# EAGLE design Adafruit Si5351C 8 Channel TCXO Clock Generator rev B (EAGLE 9.6.2)
COMPANY: ADAFRUIT INDUSTRIES; DRAWN: KTOWN; REV: A
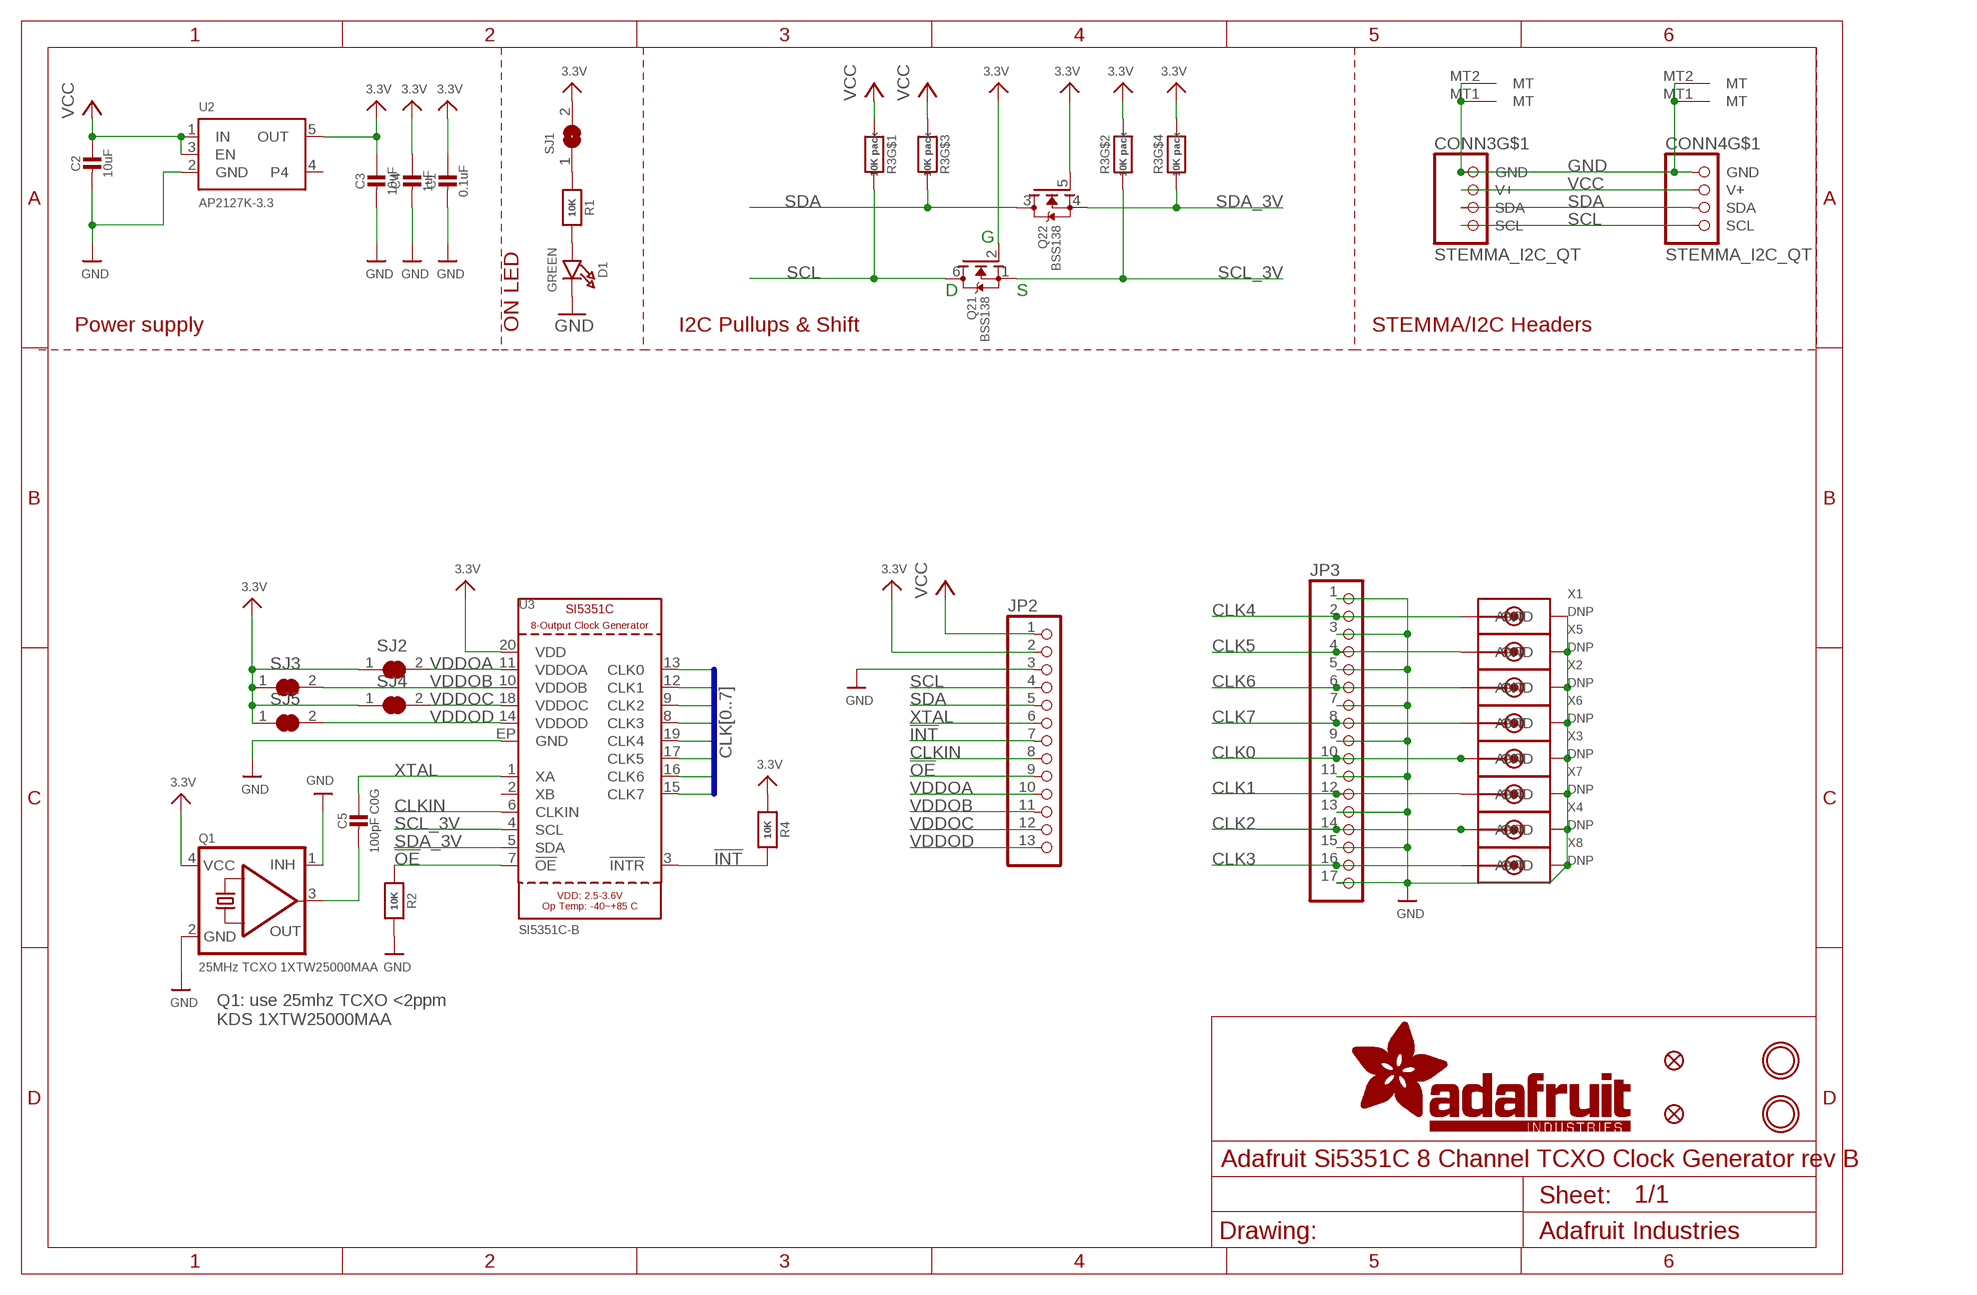
[diagram p0: schematic, sheet 1]

## Parts
C1  0.1uF  CAP_CERAMIC0603_NO  [0603-NO]
C2  10uF  CAP_CERAMIC0805-NOOUTLINE  [0805-NO]
C3  10uF  CAP_CERAMIC0805-NOOUTLINE  [0805-NO]
C4  1uF  CAP_CERAMIC0603_NO  [0603-NO]
C5  100pF C0G  CAP_CERAMIC0603_NO  [0603-NO]
CONN3  STEMMA_I2C_QT  [JST_SH4]
CONN4  STEMMA_I2C_QT  [JST_SH4]
D1  GREEN  LED0603_NOOUTLINE  [CHIPLED_0603_NOOUTLINE]
FID3  FIDUCIAL_0.5MM  [FIDUCIAL_0.5MM]
FID4  FIDUCIAL_0.5MM  [FIDUCIAL_0.5MM]
JP2  HEADER-1X13  [1X13_ROUND_70]
JP3  HEADER-1X17  [1X17_ROUND70]
Q1  25MHz TCXO 1XTW25000MAA  OSCILLATOR3.2X2.5  [OSC_3.2X2.5MM]
Q2  BSS138  MOSFET-N_DUAL  [SOT363]
R1  10K  RESISTOR_0603_NOOUT  [0603-NO]
R2  10K  RESISTOR_0603_NOOUT  [0603-NO]
R3  10K pack  RESISTOR_4PACK  [RESPACK_4X0603]
R4  10K  RESISTOR_0603_NOOUT  [0603-NO]
SJ1  SOLDERJUMPERCLOSED  [SOLDERJUMPER_CLOSEDWIRE]
SJ2  SOLDERJUMPER_CLOSED  [SOLDERJUMPER_CLOSEDWIRE]
SJ3  SOLDERJUMPER_CLOSED  [SOLDERJUMPER_CLOSEDWIRE]
SJ4  SOLDERJUMPER_CLOSED  [SOLDERJUMPER_CLOSEDWIRE]
SJ5  SOLDERJUMPER_CLOSED  [SOLDERJUMPER_CLOSEDWIRE]
U2  AP2127K-3.3  VREG_SOT23-5  [SOT23-5]
U3  SI5351C-B  SI5351C  [QFN20_4X4_0.5_SKY]
U$19  MOUNTINGHOLE2.5  [MOUNTINGHOLE_2.5_PLATED]
U$21  MOUNTINGHOLE2.5  [MOUNTINGHOLE_2.5_PLATED]
X1  DNP  SMA_EDGE  [SMA_EDGELAUNCH]
X2  DNP  SMA_EDGE  [SMA_EDGELAUNCH]
X3  DNP  SMA_EDGE  [SMA_EDGELAUNCH]
X4  DNP  SMA_EDGE  [SMA_EDGELAUNCH]
X5  DNP  SMA_EDGE  [SMA_EDGELAUNCH]
X6  DNP  SMA_EDGE  [SMA_EDGELAUNCH]
X7  DNP  SMA_EDGE  [SMA_EDGELAUNCH]
X8  DNP  SMA_EDGE  [SMA_EDGELAUNCH]

## Nets
3.3V [lowpower]: C1.1 C3.1 C4.1 JP2.2 Q1.4(VCC) Q2.2(1:G) Q2.5(2:G) R3.2 R3.4 R4.1 SJ1.2 SJ2.1 SJ3.1 SJ4.1 SJ5.1 U2.5(OUT) U3.20(VDD)
!INT: JP2.7 R4.2 U3.3(!INTR)
!OE: JP2.9 R2.1 U3.7(!OE)
CLK0: JP3.10 U3.13(CLK0) X3.P(ANT)
CLK1: JP3.12 U3.12(CLK1) X7.P(ANT)
CLK2: JP3.14 U3.9(CLK2) X4.P(ANT)
CLK3: JP3.16 U3.8(CLK3) X8.P(ANT)
CLK4: JP3.2 U3.19(CLK4) X1.P(ANT)
CLK5: JP3.4 U3.17(CLK5) X5.P(ANT)
CLK6: JP3.6 U3.16(CLK6) X2.P(ANT)
CLK7: JP3.8 U3.15(CLK7) X6.P(ANT)
CLKIN: JP2.8 U3.6(CLKIN)
GND [highpower]: C1.2 C2.2 C3.2 C4.2 CONN3.1(GND) CONN3.MT1(MT) CONN3.MT2(MT) CONN4.1(GND) CONN4.MT1(MT) CONN4.MT2(MT) D1.C JP2.3 JP3.1 JP3.3 JP3.5 JP3.7 JP3.9 JP3.11 JP3.13 JP3.15 JP3.17 Q1.1(INH) Q1.2(GND) R2.2 U2.2(GND) U3.EP(GND) X1.GND@1(GND) X1.GND@2(GND) X1.GND@3(GND) X1.GND@4(GND) X2.GND@1(GND) X2.GND@2(GND) X2.GND@3(GND) X2.GND@4(GND) X3.GND@1(GND) X3.GND@2(GND) X3.GND@3(GND) X3.GND@4(GND) X4.GND@1(GND) X4.GND@2(GND) X4.GND@3(GND) X4.GND@4(GND) X5.GND@1(GND) X5.GND@2(GND) X5.GND@3(GND) X5.GND@4(GND) X6.GND@1(GND) X6.GND@2(GND) X6.GND@3(GND) X6.GND@4(GND) X7.GND@1(GND) X7.GND@2(GND) X7.GND@3(GND) X7.GND@4(GND) X8.GND@1(GND) X8.GND@2(GND) X8.GND@3(GND) X8.GND@4(GND)
N$1: D1.A R1.2
N$2 [lowpower]: R1.1 SJ1.1
N$4: C5.2 Q1.3(OUT)
SCL: CONN3.4(SCL) CONN4.4(SCL) JP2.4 Q2.6(1:D) R3.8
SCL_3V: Q2.1(1:S) R3.7 U3.4(SCL)
SDA: CONN3.3(SDA) CONN4.3(SDA) JP2.5 Q2.3(2:D) R3.6
SDA_3V: Q2.4(2:S) R3.5 U3.5(SDA)
VCC [highpower]: C2.1 CONN3.2(V+) CONN4.2(V+) JP2.1 R3.1 R3.3 U2.1(IN) U2.3(EN)
VDDOA: JP2.10 SJ2.2 U3.11(VDDOA)
VDDOB: JP2.11 SJ3.2 U3.10(VDDOB)
VDDOC: JP2.12 SJ4.2 U3.18(VDDOC)
VDDOD: JP2.13 SJ5.2 U3.14(VDDOD)
XTAL: C5.1 JP2.6 U3.1(XA)
Unconnected: U2.4 U3.2(XB)

## Buses
CLK[0..7]

## Notes on the sheet
- G
- D | S
- Power supply | ON LED | I2C Pullups & Shift | STEMMA/I2C Headers
- Q1: use 25mhz TCXO <2ppm
  KDS 1XTW25000MAA

## Library data of the parts
C1-C5 = microbuilder:CAP_CERAMIC: Ceramic Capacitors For new designs, use the packages preceded by an '_' character since they are more reliable: The following footprints should be used on most boards: _0402 - Standard footprint for regular board layouts _0603 - Standard footprint for regular board layouts _0805 - Standard footprint for regular board layouts _1206 - Standard footprint for regular board layouts For extremely tight-pitch boards where space is at a premium, the following 'micro-pitch' footprints can be used (smaller pads, no silkscreen outline, etc.): _0402MP - Micro-pitch footprint for very dense/compact boards _0603MP - Micro-pitch footprint for very dense/compact boards _0805MP - Micro-pitch footprint for very dense/compact boards _1206MP - Micro-pitch footprint for very dense/compact boards
CONN3 CONN4 = adafruit_electromech:STEMMA_I2C; LCSC: C2905006
D1 = microbuilder:LED: LED 0603 - 0603 Surface Mount Package 2mA: Green LED - Low Power (3.9mcd, 2ma, 1.7Vf) - Digikey: 475-2709-2-ND Orange LED - Low Power (9.8mcd, 2ma, 1.8Vf) - Digikey: 475-1194-2-ND Red LED - Low Power (5mcd, 2ma, 1.8Vf) - Digikey: 475-1195-2-ND Yellow LED - Low Power (7mcd, 2ma, 1.8Vf) - Digikey: 475-1196-2-ND 5mA: Blue LED - Low Power (17mcd, 5ma, 2.9Vf) - Digikey: LNJ937W8CRACT-ND 0805 - 0805 Surface Mount Package 2mA: Red LED (8.8mcd, 2mA, 1.8Vf, Clear) - Low Power [Digikey: 475-2510-1-ND] Green LED (5mcd, 2mA, 1.8Vf, Clear) - Low Power [Digikey: 475-2730-1-ND] Yellow LED (11.3mcd, 2mA, 1.8Vf, Clear) - Low Power [Digikey: 475-2555-1-ND] 20mA: Red LED (104mcd, 20mA, Diffused) - LS R976 [Digikey: 475-1278-6-ND] Red LED (12mcd, 20mA, 2.0Vf, Clear) - APT2012EC [Digikey: 754-1128-1-ND] Green LED (15mcd, 20mA, 2.2Vf, Clear) - APT2012GC [Digikey: 754-1131-1-ND] Orange LED (160mcd, 20mA, 2.1Vf, Clear) - APT2012SECK [Digikey: 754-1130-1-ND] 1206 - 1206 Surface Mount Package Green LED (26mcd, 20mA, Diffused) - LG N971 [Digikey: 475-1407-6-ND] Red LED (15mcd, 20mA, Diffused) - LH N974 [Digikey: 475-1416-6-ND] Cree - Cree High-Power Surface Mount LEDs XPEBWT-L1-0000-00D50 - White 111lm 350mA 2.9Vf 6200K 110° XTEAWT-00-0000-00000LEE3 - White 114lm 350mA 2.85Vf 5000K 115° Everlight - Everlight 45-21 Series Surface Mount LEDs 45-21/QK2C-B2832AC2CB2/2T - Warm White 2000mcd 20mA 3.25Vf 3050K 120° 45-21/LK2C-B38452C4CB2/2T - Nuetral White 2000mcd 20mA 3.25Vf 4150K 120° 45-21/LK2C-B50634C6CB2/2T - Cold White 2200mcd 20mA 3.25Vf 5650K 120° PLCC2 Reverse Mount LS T77K-J1L2-1-0-2-R18-Z - Red 11.25mcd 2mA 1.8Vf 630nm 120° LO T77K-L1M2-24-Z - Orange 19.6mcd 2mA 1.8Vf 606nm 120° LY T77K-K2M1-26-Z - Yellow 15.7mcd 2mA 1.8Vf 587nm 120°; ROT: 270
FID3 FID4 = microbuilder:FIDUCIAL: Fiducial Alignment Points Various fiducial points for machine vision alignment.
JP2 = adafruit_electromech:HEADER-1X13
JP3 = microbuilder:HEADER-1X17: Header 1x17
Q1 = microbuilder:OSCILLATOR: Oscillators 3.2x2.5mm SMT 4.0MHz +/- 50ppm, 3.3V, 9mA, -40/+85°C - Digikey: 535-9752-1-ND 50MHz +/- 50ppm, 3.3V, 8mA, -10/+70°C - Digikey: 478-4792-1-ND 5x7mm SMT 4.0MHz +/-20ppm 3.3V, 20mA, -20/+70°C - Digikey: 535-9329-2-ND 50MHz +/- 25ppm 3.3V, 35mA, -40/+85°C - Digikey: 631-1197-1-ND
Q2 = microbuilder:MOSFET-N_DUAL: Dual N-Channel MOSFET SOT363 (2.0x1.25mm) 2N7002PS - 60V, 320mA [Digikey: 568-5984-1-ND]; JLC_ROTATION: 270
R1 R2 R4 = microbuilder:RESISTOR: Resistors For new designs, use the packages preceded by an '_' character since they are more reliable: The following footprints should be used on most boards: _0402 - Standard footprint for regular board layouts _0603 - Standard footprint for regular board layouts _0805 - Standard footprint for regular board layouts _1206 - Standard footprint for regular board layouts For extremely tight-pitch boards where space is at a premium, the following 'micro-pitch' footprints can be used (smaller pads, no silkscreen outline, etc.): _0402MP - Micro-pitch footprint for very dense/compact boards _0603MP - Micro-pitch footprint for very dense/compact boards _0805MP - Micro-pitch footprint for very dense/compact boards _1206MP - Micro-pitch footprint for very dense/compact boards
R3 = microbuilder:RESISTOR_4PACK: Resistor Packs (4 resistors) 4 x 0603 10K 1/16W - Digikey: YC164J-10KCT-ND
SJ1 = microbuilder:SOLDERJUMPER: SMD Solder JUMPER Solder the two pads together to create a connection, or remove the solder to break it. REFLOW - Use this footprint for solder paste and reflow ovens. WAVE - Use this footprint for hand-soldering (larger pads). CLOSED - Has a trace between the two pads to ensure it is closed by default. The trace needs to be cut to disable the jumper, and can be closed again by creating a solder bridge between the two pads.
SJ2-SJ5 = microbuilder:SOLDERJUMPER_CLOSED: Solder Jumper - Closed These solder jumpers are closed by default CLOSEDWIRE - 10 mil trace between pads that can be cut and resoldered later CLOSEDPERM - 63 mil trace between pads for a permanent connection (used to 'bridge' two signals, a shameless hack for Eagle). Can double as a test point as well (no cream layer)
U2 = adafruit_power:VREG_SOT23-5: SOT23-5 Fixed Voltage Regulators Part Current Out V Out V In V Dropout θJA (°C/W) TJ (°C) Digikey Part No. ADP121 150mA 3.3V 3.4-5.5V 0.09V @ 150mA -- -- ADP121-AUJZ33R7CT-ND ADP121 150mA 3.0V 3.1-5.5V 0.09V @ 150mA -- -- ADP121-AUJZ30R7CT-ND ADP122 300mA 3.3V 3.4-5.5V 0.085V @ 300mA -- -- ADP122AUJZ-3.3-R7CT-ND ADP1712 300mA 3.3V 3.5-5.5V 0.17V @ 300mA -- -- ADP1712AUJZ-3.3-R7TR-ND AP7311 (Low Cost) 150mA 3.3V 3.5-6V 0.15V @ 150mA -- -- AP7311-33WG-7DICT-ND LD39015M18R 150mA 1.8V 1.9V-5.5V 0.08V @ 100mA -- -- 497-6977-1-ND LP2985A-33DBVR 150mA 3.3V 3.3-16V 0.28V @ 150mA 206 150 296-18479-1-ND MCP1824T-3302E/OT 300mA 3.3V 3.5V-6V 0.2V @ 300mA -- -- MCP1824T-3302E/OTCT-ND MIC5205-2.5YM5 TR 150mA 2.5V 2.7-16V 0.165V @ 150mA -- -- 576-1257-2-ND MIC5205-3.0YM5 TR 150mA 3.0V 3.2V-16V 0.165V @ 150mA -- -- 576-1258-2-ND MIC5205-3.3YM5 TR 150mA 3.3V 3.5V-16V 0.165V @ 150mA -- -- 576-1259-2-ND TPS780330220 150mA 3.3V+2.2V 3.6-5.5V 250mV Max -- -- 296-23332-1-ND TDA3663/N1,135 100mA 3.3V 3.5-45V 0.18V @ 50mA -- -- 568-5343-1-ND Max operating temp can be calculated using θJA, TJ (max junction temperature), and power in watts. Set the "Maximum Ambient Temperature" until it reaches TJ ("Max Junction Temperature"), which is the absolute limit for safe use of the regulator: Heat Sink Temperature Calculator <http://www.daycounter.com/Calculators/Heat-Sink-Temperature-Calculator.phtml> For example, With 12V source into a 3.3V LP2985 and a 30mA load, we are dissipating (12V-3.3V) * 0.03A = 0.261W. With a θJA of 206 °C/W, a TJ of 150°C, and 261mW we can safely use the chip without a heat sink up to 75°C (=147.1°C Junction Temperature).; JLC_ROTATION: 270
U3 = microbuilder:SI5351C: SI5351C - 8-Output I2C Clock Generator with External Clock Input Skyworks (formerly Silicon Labs) Si5351C. Any-frequency clock generator with two PLLs and 8 independent output drivers (CLK0-CLK7). Drives separate output banks (CLK0/1, CLK2/3, CLK4/5, CLK6/7) with independent VDDO supplies (1.8/2.5/3.3V). I2C control. Includes external clock input (CLKIN) and open-drain interrupt output (INTR). VDD: 2.5-3.6V. Op temp: -40~+85 C. 20-pin QFN 4x4mm 0.5mm pitch.
U$19 U$21 = adafruit_electromech:MOUNTINGHOLE: Mounting Hole For #2 screws (0.086"/2.18mm width, 0.094"/2.4mm hole) use 2.5mm; BOM: EXCLUDE
X1-X8 = microbuilder:SMA_EDGE: SMA Edge-Launch Connector - simplified single-GND symbol 50 Ohm SMA edge-launch (or U.FL footprint variant). Functionally identical to SMACONNECTOR_EDGE/_EDGE_UFL but with a single GND symbol pin instead of GND1-4 — easier to wire in new schematics.

## Net classes
1 highpower: width 0.305 mm, drill 0.483 mm
2 lowpower: width 0.254 mm, drill 0.483 mm

## Board
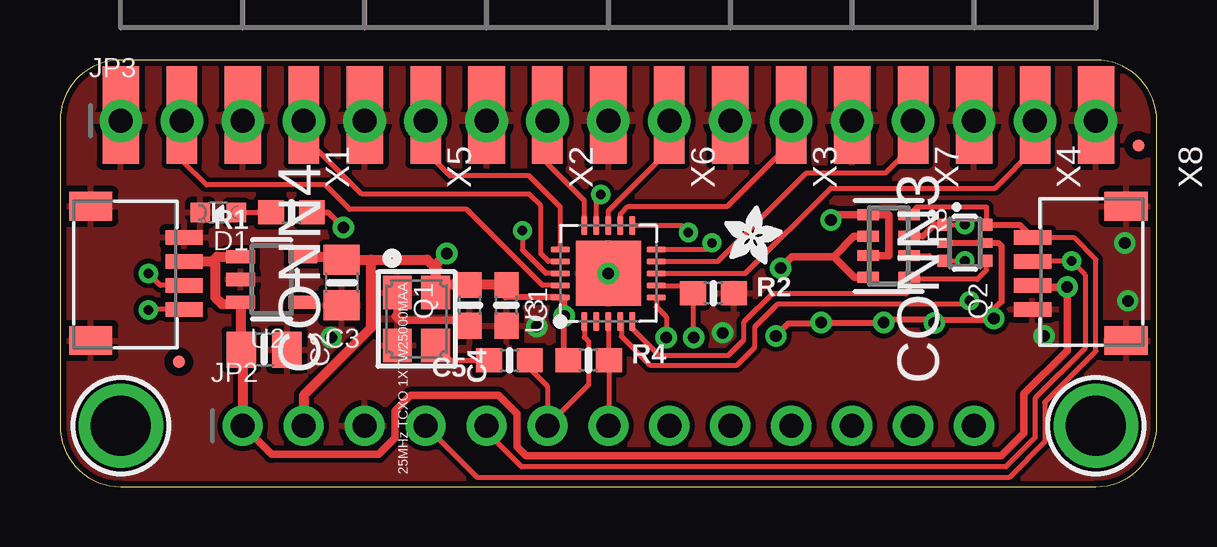
[diagram p1: board, top side]
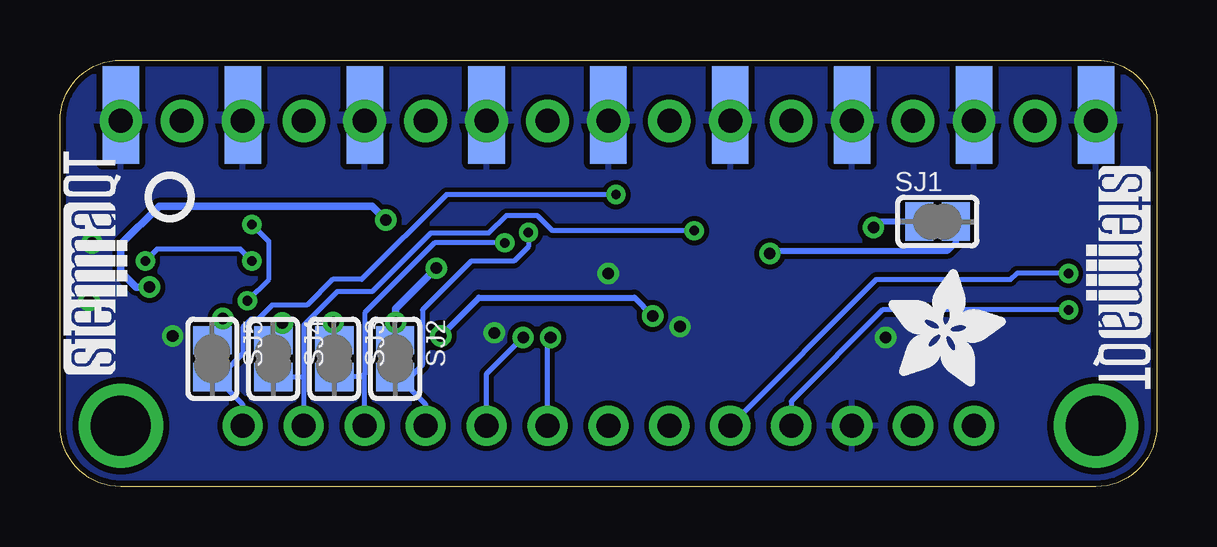
[diagram p2: board, bottom side, seen from below]

Size 45.72 x 17.78 mm. Coordinates in mm from the lower left corner, seen from the top.
Outline: 0,15.24 0,2.54 arc90 2.54,0 43.18,0 arc90 45.72,2.54 45.72,15.24 arc90 43.18,17.78 2.54,17.78 arc90 0,15.24
Copper layers (1*16): Top 0.035mm / dielectric 1.5mm / Bottom 0.035mm
Design rules "adafruit *": minimum track width 8mil, minimum drill 15.5mil, track to track 8mil, track to pad 8mil, pad to pad 8mil, via to via 8mil, smd to smd 8mil, copper to edge 10mil, drill to drill 8mil, minimum pad ring 10mil, minimum via ring 8mil, stop-mask expansion 2mil, vias tented up to drill 20mil, thermal gap 10mil

### Footprints (pad centres in the part's own frame; a part is rotated, then mirrored left to right if it is on the bottom)
0603-NO = smd 1.075 x 1: 1 -0.85,0; 2 0.85,0
0805-NO = smd 1.24 x 1.5: 1 -0.95,0; 2 0.95,0
JST_SH4 = smd 0.6 x 1.55: 1 -1.5,2.006; 2 -0.5,2.006; 3 0.5,2.006; 4 1.5,2.006 | smd 1.2 x 1.8: MT1 -2.8,-1.894; MT2 2.8,-1.894
CHIPLED_0603_NOOUTLINE = smd 0.8 x 0.8: A 0,-0.75; C 0,0.75
FIDUCIAL_0.5MM = smd 0.5 x 0.5: 1 0,0
1X13_ROUND_70 = drill 1 pad 1.676: 1 -15.24,0; 2 -12.7,0; 3 -10.16,0; 4 -7.62,0; 5 -5.08,0; 6 -2.54,0; 7 0,0; 8 2.54,0; 9 5.08,0; 10 7.62,0; 11 10.16,0; 12 12.7,0; 13 15.24,0
1X17_ROUND70 = drill 1 pad 1.778: 1 -20.32,0; 2 -17.78,0; 3 -15.24,0; 4 -12.7,0; 5 -10.16,0; 6 -7.62,0; 7 -5.08,0; 8 -2.54,0; 9 0,0; 10 2.54,0; 11 5.08,0; 12 7.62,0; 13 10.16,0; 14 12.7,0; 15 15.24,0; 16 17.78,0; 17 20.32,0
OSC_3.2X2.5MM = smd 1.4 x 1.2: 1 -1.1,-0.8; 2 1.1,-0.8; 3 1.1,0.8; 4 -1.1,0.8
SOT363 = smd 0.5 x 0.5: 1 -0.75,-0.9; 3 0.75,-0.9; 4 0.75,0.9; 6 -0.75,0.9 | smd 0.4 x 0.5: 2 0,-0.9; 5 0,0.9
RESPACK_4X0603 = smd 0.45 x 0.9: 1 -1.3,-0.85; 2 -0.4,-0.85; 3 0.4,-0.85; 4 1.3,-0.85; 5 1.3,0.85; 6 0.4,0.85; 7 -0.4,0.85; 8 -1.3,0.85
SOLDERJUMPER_CLOSEDWIRE = smd 1.168 x 1.6: 1 -0.762,0; 2 0.762,0 | smd 0.635 x 0.203: WIRE 0,0
SOT23-5 = smd 0.55 x 1.2: 1 -0.95,-1.3; 2 0,-1.3; 3 0.95,-1.3; 4 0.95,1.3; 5 -0.95,1.3
QFN20_4X4_0.5_SKY = smd 0.8 x 0.25: 1 -2,1; 2 -2,0.5; 3 -2,0; 4 -2,-0.5; 5 -2,-1; 11 2,-1; 12 2,-0.5; 13 2,0; 14 2,0.5; 15 2,1 | smd 0.25 x 0.8: 6 -1,-2; 7 -0.5,-2; 8 0,-2; 9 0.5,-2; 10 1,-2; 16 1,2; 17 0.5,2; 18 0,2; 19 -0.5,2; 20 -1,2 | smd 2.7 x 2.7: EP 0,0
MOUNTINGHOLE_2.5_PLATED = drill 2.5 pad 3.2: P$1 0,0
SMA_EDGELAUNCH = smd 4.064 x 1.524: GND@1 2.032,-2.54; GND@2 2.032,2.54 | smd 4.064 x 1.524 bottom: GND@3 2.032,2.54; GND@4 2.032,-2.54 | smd 4.064 x 1.27: P 2.032,0

### Placement (x,y rotation side)
C1  18.61,7.56 270 top
C2  8.51,5.71 0 top
C3  11.75,8.51 270 top
C4  17.08,7.56 270 top
C5  18.73,5.27 180 top
CONN3  42.55,8.89 90 top
CONN4  3.17,8.89 270 top
D1  6.6,11.43 90 top
FID3  4.95,5.21 0 top
FID4  44.96,14.22 0 top
JP2  22.86,2.54 0 top
JP3  22.86,15.24 0 top
PLABEL0  [PLABEL0]  7.75,0.89 0 top
PLABEL1  [PLABEL1]  10.16,4.06 0 top
PLABEL2  [PLABEL2]  12.7,0.89 0 top
PLABEL3  [PLABEL3]  15.11,4.06 0 top
PLABEL4  [PLABEL4]  17.91,0.89 0 top
PLABEL5  [PLABEL5]  6.22,10.1 0 top
PLABEL11  [PLABEL11]  32.38,1.02 0 bottom
PLABEL12  [PLABEL12]  5.84,10.92 0 bottom
PLABEL13  [PLABEL13]  12.06,0.89 0 bottom
PLABEL14  [PLABEL14]  2.54,12.7 0 top
PLABEL15  [PLABEL14]  7.62,12.7 0 top
PLABEL16  [PLABEL14]  12.7,12.7 0 top
PLABEL17  [PLABEL14]  17.78,12.7 0 top
PLABEL18  [PLABEL14]  22.86,12.7 0 top
PLABEL19  [PLABEL14]  27.94,12.7 0 top
PLABEL20  [PLABEL14]  33.02,12.7 0 top
PLABEL21  [PLABEL14]  38.1,12.7 0 top
PLABEL22  [PLABEL22]  5.08,12.7 0 top
PLABEL23  [PLABEL23]  10.16,12.7 0 top
PLABEL24  [PLABEL24]  15.24,12.7 0 top
PLABEL25  [PLABEL25]  20.32,12.7 0 top
PLABEL26  [PLABEL26]  25.4,12.7 0 top
PLABEL27  [PLABEL27]  30.48,12.7 0 top
PLABEL28  [PLABEL28]  35.56,12.7 0 top
PLABEL29  [PLABEL29]  40.64,12.7 0 top
PLABEL30  [PLABEL14]  43.18,12.7 0 top
PLABEL31  [PLABEL31]  20.32,4.06 0 top
PLABEL32  [PLABEL32]  25.4,4.06 0 top
PLABEL34  [PLABEL34]  33.02,1.02 0 top
PLABEL35  [PLABEL35]  38.35,1.02 0 top
PLABEL36  [PLABEL36]  22.86,0.89 0 top
PLABEL37  [PLABEL37]  27.94,0.89 0 top
PLABEL38  [PLABEL38]  30.48,3.94 0 top
PLABEL39  [PLABEL39]  35.56,3.94 0 top
PLABEL40  [PLABEL40]  16.64,10.54 0 top
PLABEL41  [PLABEL41]  33.78,7.11 0 top
PLABEL42  [PLABEL42]  33.78,5.46 0 top
PLABEL43  [PLABEL43]  31.75,7.24 90 bottom
PLABEL44  [PLABEL44]  34.29,7.24 90 bottom
PLABEL45  [PLABEL45]  36.83,7.24 90 bottom
PLABEL46  [PLABEL46]  39.5,7.24 90 bottom
PLABEL47  [PLABEL47]  20.57,8.38 0 bottom
Q1  14.86,6.99 270 top
Q2  37.72,10.16 270 top
R1  9.65,11.43 180 top
R2  27.24,8.06 0 top
R3  34.54,10.03 270 top
R4  22.03,5.27 0 top
SJ1  9.14,11.05 0 bottom
SJ2  31.75,5.33 270 bottom
SJ3  34.29,5.33 270 bottom
SJ4  36.83,5.33 270 bottom
SJ5  39.37,5.33 270 bottom
U2  8.83,8.64 270 top
U3  22.86,8.89 90 top
U$4  [ADAFRUIT_5MM]  11.18,4.19 0 bottom
U$9  [ADAFRUIT_2.5MM]  27.69,9.27 0 top
U$19  2.54,2.54 0 top
U$21  43.18,2.54 0 top
U$25  [PCBFEAT-REV-040]  41.15,12.06 0 bottom
U$30  [STEMMAQT]  42.93,4.7 90 bottom
U$31  [STEMMAQT]  2.92,13.34 270 bottom
X1  5.08,17.53 270 top
X2  15.24,17.53 270 top
X3  25.4,17.53 270 top
X4  35.56,17.53 270 top
X5  10.16,17.53 270 top
X6  20.32,17.53 270 top
X7  30.48,17.53 270 top
X8  40.64,17.53 270 top

### Tracks (layer width: path | path; a pad name or v marks a point on that pad's centre or on a via)
3.3V  (via drill 0.48)
  Top 0.254: Q2.2 Q2.5 39.12,10.16 39.24,10.03 39.24,7.7 38.48,6.94 | v38.93,7 38.86,6.94 38.48,6.94 | 38.48,6.94 36.45,6.94 v36.45,6.82 36.3,6.96 34.46,6.96 v34.33,6.84 v31.73,6.84 31.69,6.79 30.35,6.79 v29.84,6.29 | R4.1 21.02,5.44 v21.02,7.11 21.02,7.89 U3.20 18.57,7.89 18.06,8.41 C4.1
  Top 0.305: R3.4 33.11,8.73 32.26,9.59 | v30.04,9.11 30.52,9.59 32.26,9.59 | R3.2 33.1,10.43 32.26,9.59
  Top 0.406: 12.95,9.46 15.31,9.46 15.62,9.14 | U2.5 11.62,9.59 C3.1 12.95,9.46 | 12.95,9.46 12.95,6.6 10.16,3.81 JP2.2 | 15.62,9.14 15.76,9.01 15.66,8.91 15.66,8.51 | C1.1 C4.1 15.76,8.41 15.66,8.51 | 15.62,9.14 15.62,9.21 v16.13,9.72 | Q1.4 15.66,8.51
  Bottom 0.254: v34.33,6.84 34.33,6.14 SJ3.1 | v31.73,6.84 31.75,6.84 SJ2.1 | v36.45,6.82 36.45,6.48 SJ4.1 | SJ5.1 38.93,6.54 v38.93,7 | v16.13,9.72 16,9.84 8.7,9.84 8.38,10.16 SJ1.2 | v29.84,6.29 28.26,7.87 21.78,7.87 v21.02,7.11
  Bottom 0.305: v30.04,9.11 31.73,7.41 v31.73,6.84
!INT
  Top 0.203: U3.3 22.86,5.29 R4.2 22.88,2.56 JP2.7
!OE  (via drill 0.48)
  Top 0.203: U3.7 24.91,8.35 26.11,8.35 R2.1 26.42,8.04 v26.42,6.22
  Bottom 0.203: JP2.9 27.94,4.7 v26.42,6.22
CLK0
  Top 0.203: U3.13 22.86,11.49 25.4,14.03 JP3.10
  Top 0.406: X3.P JP3.10
CLK1
  Top 0.203: U3.12 23.36,11.36 23.69,11.68 27.81,11.68 30.48,14.35 JP3.12
  Top 0.406: X7.P JP3.12
CLK2
  Top 0.203: U3.9 27.42,9.39 31.11,13.08 34.42,13.08 35.56,14.22 JP3.14
  Top 0.406: X4.P JP3.14
CLK3
  Top 0.203: U3.8 28.57,8.89 32.13,12.45 38.99,12.45 40.64,14.1 JP3.16
  Top 0.406: X8.P JP3.16
CLK4
  Top 0.203: U3.19 20.12,8.39 16.95,11.56 12.06,11.56 11.05,12.57 6.1,12.57 5.08,13.59 JP3.2
  Top 0.406: JP3.2 X1.P
CLK5
  Top 0.203: U3.17 20.36,9.39 20.05,9.7 20.05,11.7 19.56,12.19 12.57,12.19 10.16,14.61 10.16,15.11 JP3.4
  Top 0.406: X5.P 10.16,15.11
CLK6
  Top 0.203: JP3.6 15.24,13.97 16.26,12.95 19.56,12.95 20.86,11.65 U3.16
  Top 0.406: X2.P JP3.6
CLK7
  Top 0.203: U3.15 21.86,11.92 20.32,13.46 JP3.8
  Top 0.406: X6.P JP3.8
CLKIN  (via drill 0.48)
  Top 0.203: v25.27,6.22 25.27,7.08 24.86,7.49 U3.6
  Bottom 0.203: JP2.8 25.4,6.1 v25.27,6.22
GND  (via drill 0.48)
  Top 0.305: Q1.1 14.06,7.2 13.97,7.11 14.14,6.94 16.41,6.94 16.64,6.71 C4.2
  other vias: 44.51,7.75 44.39,10.16 22.86,8.89 27.62,6.41 41.02,6.29 19.88,6.67 11.3,6.22
  pour Top: 0,17.72 45.72,17.72 45.72,0 0,0
  pour Bottom: 0,17.84 45.72,17.84 45.72,0 0,0
N$1
  Top 0.203: D1.A R1.2
N$2  (via drill 0.48)
  Top 0.254: R1.1 11.18,11.43 v11.81,10.79
  Bottom 0.254: v11.81,10.79 11.55,11.05 SJ1.1
N$4
  Top 0.203: Q1.3 16.27,5.27 C5.2
SCL  (via drill 0.4)
  Top 0.203: R3.8 35.71,11.65 38.62,11.65 Q2.6 | CONN4.4 3.71,7.39 v3.68,7.37 | CONN3.4 42.25,10.39 43.18,9.46 43.18,5.65 41.05,3.52 41.05,1.86 39.56,0.38 17.4,0.38 JP2.4
  Top 0.254: Q2.6 40.02,10.91 CONN3.4
  Bottom 0.203: JP2.4 15.24,3.56 11.43,7.37 v3.68,7.37
SCL_3V  (via drill 0.4)
  Top 0.203: U3.4 23.41,6.84 23.41,6.27 24.6,5.07 28.23,5.07 28.97,5.81 28.97,6.66 29.92,7.61 37.77,7.61 v37.91,7.75 | Q2.1 37.71,10.91 v37.72,10.92
  Top 0.254: Q2.1 36.44,10.91 35.96,10.43 R3.7
  Bottom 0.203: v37.72,10.92 37.01,10.21 37.01,8.65 v37.91,7.75
SDA  (via drill 0.4)
  Top 0.203: R3.6 36.24,9.63 36.46,9.41 Q2.3 37.71,9.41 v37.72,9.4 | CONN4.3 4.18,8.39 v3.68,8.89 | CONN3.3 v42.16,9.39 v42.16,9.4 42.74,8.83 42.74,5.78 40.64,3.68 40.64,2.03 39.43,0.83 19.24,0.83 17.78,2.29 JP2.5
  Bottom 0.203: v37.72,9.4 38.23,9.91 41.66,9.91 v42.16,9.4 | JP2.5 11.68,8.64 6.1,8.64 5.84,8.89 v3.68,8.89
SDA_3V
  Top 0.203: Q2.4 38.62,9.03 38.23,8.64 35.48,8.64 R3.5 35.39,8.16 35.27,8.04 29.69,8.04 28.5,6.84 28.5,6.1 27.87,5.47 24.96,5.47 23.86,6.58 U3.5
VCC  (via drill 0.48)
  Top 0.305: R3.3 34.54,9.63 34.54,11.33 R3.1 32.36,11.33 v32.14,11.11 | CONN3.2 40.61,8.32 v41.99,8.32 41.99,5.68 40.18,3.87 40.18,2.22 39.24,1.28 19.43,1.28 19.05,1.66 19.05,3.05 18.29,3.81 14.61,3.81 13.97,3.17 13.97,2.03 13.28,1.35 8.81,1.35 JP2.1
  Top 0.406: 7.56,7.62 C2.1 7.62,5.65 JP2.1 | 7.56,7.62 7.56,7.65 U2.3 | CONN4.2 6.34,9.39 | U2.1 6.54,9.59 6.34,9.39 | 6.34,9.39 6.48,9.26 6.48,7.87 6.73,7.62 7.56,7.62
  Bottom 0.305: v32.14,11.11 32.71,11.68 41.59,11.68 43.18,10.1 43.18,8.95 42.55,8.32 v41.99,8.32
VDDOA  (via drill 0.39)
  Top 0.203: U3.11 25.9,10.89 v26.19,10.6
  Bottom 0.203: v26.19,10.6 26.19,10 26.8,9.4 28.57,9.4 30.61,7.37 30.61,5.08 31.11,4.57 31.62,4.57 | 31.62,4.57 SJ2.2 | JP2.10 30.48,3.43 31.62,4.57
VDDOB  (via drill 0.39)
  Top 0.203: U3.10 26.91,9.89 v27.18,10.16
  Bottom 0.203: v27.18,10.16 30.1,10.16 33.02,7.24 33.02,4.7 | 33.02,4.7 33.15,4.57 SJ3.2 | JP2.11 33.02,4.7
VDDOC  (via drill 0.39)
  Top 0.203: U3.18 20.26,8.89 19.28,9.87 v19.28,10.67
  Bottom 0.203: v19.28,10.67 25.18,10.67 25.82,11.3 27.11,11.3 27.85,10.57 30.27,10.57 32.71,8.13 34.16,8.13 35.56,6.73 35.56,4.57 | 35.56,4.57 JP2.12 | SJ4.2 35.56,4.57
VDDOD  (via drill 0.39)
  Top 0.203: U3.14 22.36,11.99 v22.54,12.17
  Bottom 0.203: v22.54,12.17 29.61,12.17 33.15,8.64 34.35,8.64 35.42,7.57 36.89,7.57 37.47,6.99 37.76,6.99 38.1,6.64 38.1,5.55 38.94,4.71 39.23,4.71 39.31,4.64 | 39.31,4.64 SJ5.2 | JP2.13 38.1,3.43 39.31,4.64
XTAL
  Top 0.203: U3.1 21.86,6.22 22.04,6.05 22.04,4.25 JP2.6 20.32,4.19 19.58,4.93 C5.1

### Text on the board
Pinguin_tBackup: G | #4 | G | #5 | G | #6 | G | #7 | G | #0 | G | #1 | G | #2 | G | #3 | G | 25MHz / TCXO | Si5351C | 8-Channel ClockGen | XTAL | CLKI | GND | VDOB | VDOD | !INT | !OE | VDOA | VDOC
Pinguin_bBackup: SI5351C-B / 8 Channel Out / 8 kHz-16 MHz / w/25MHz TCXO | VDDA | VDDB | VDDC | VDDD